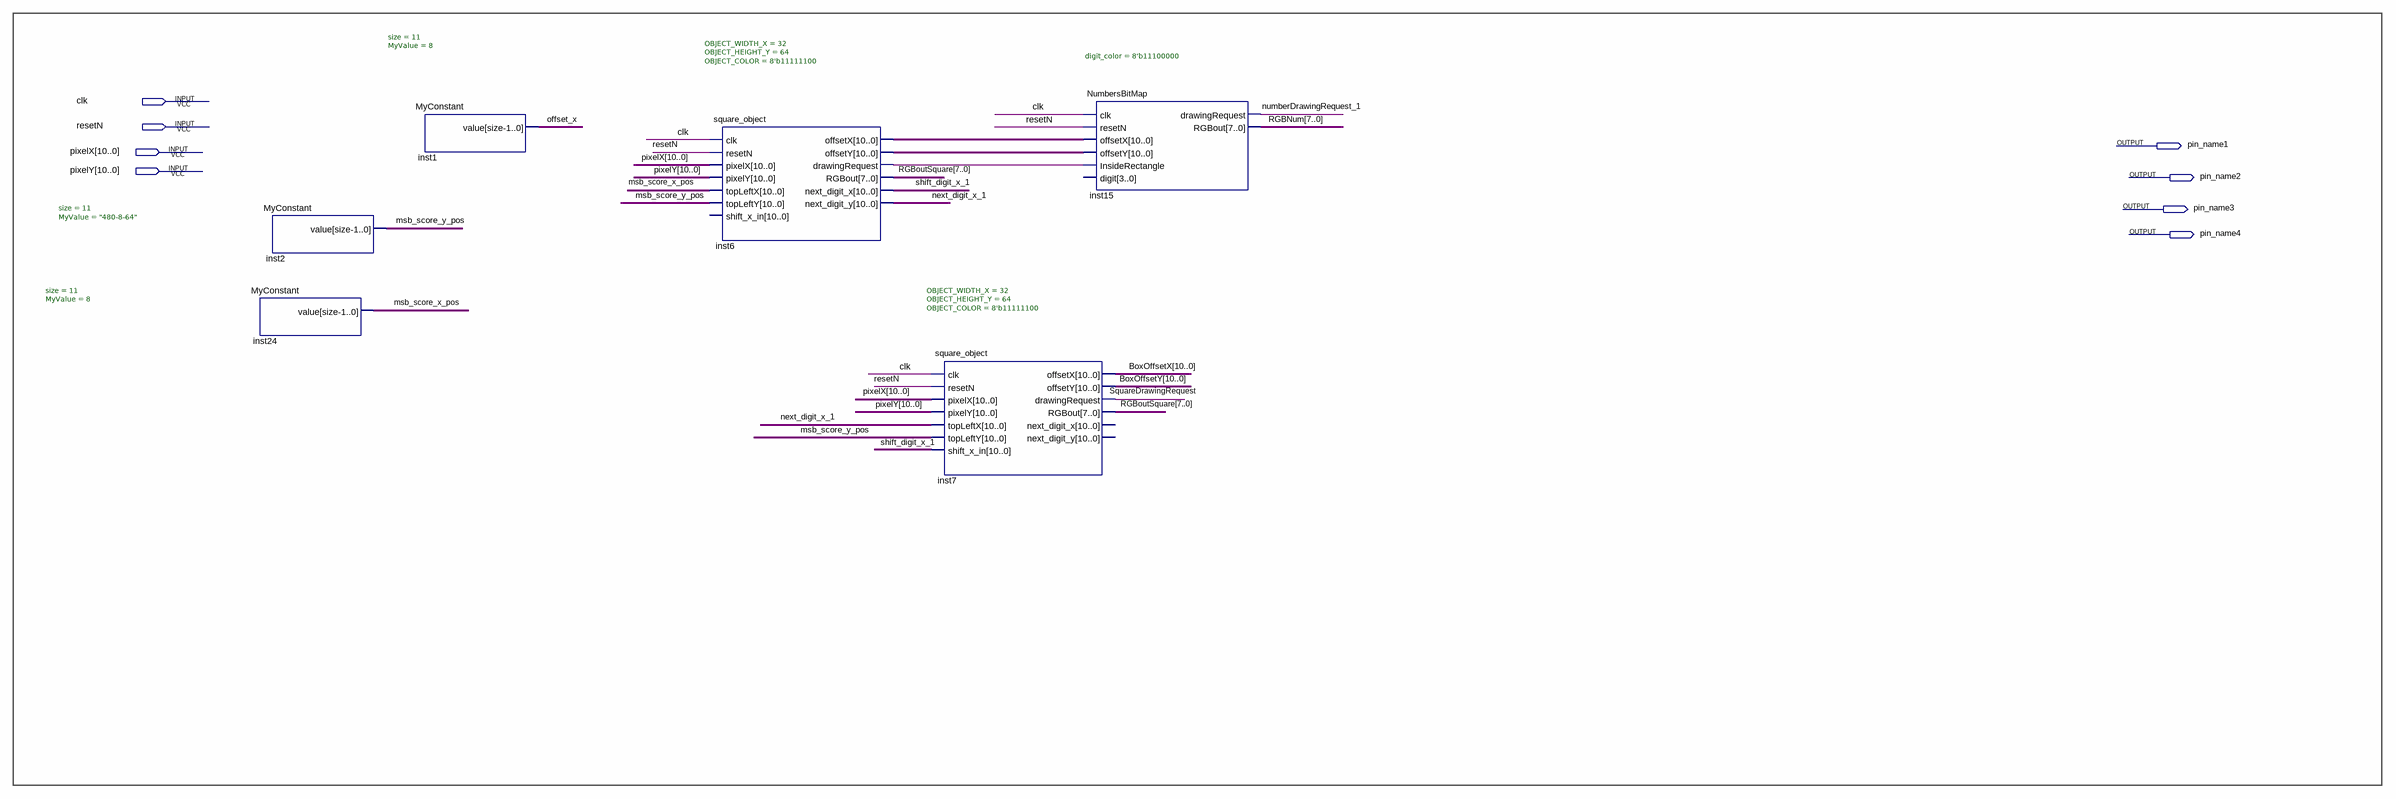
[diagram p0: schematic sheet]
// Quartus schematic 3_digits_display.bdf as structural Verilog: 6 symbols, 8 pins
module \3_digits_display  (
  input  clk,
  input  resetN,
  input  [10:0] pixelX,
  input  [10:0] pixelY,
  output pin_name1,
  output pin_name2,
  output pin_name3,
  output pin_name4
);

  wire inst6_drawingrequest, msb_score_x_pos, msb_score_y_pos, next_digit_x_1, numberDrawingRequest_1,
       offset_x, shift_digit_x_1, SquareDrawingRequest;
  wire [7:0] RGBNum, RGBoutSquare;
  wire [10:0] BoxOffsetX, BoxOffsetY, inst6_offsetx, inst6_offsety;

  MyConstant #(.size(11), .MyValue("480-8-64")) inst2 (.value(msb_score_y_pos));
  MyConstant #(.size(11), .MyValue(8)) inst24 (.value(msb_score_x_pos));
  MyConstant #(.size(11), .MyValue(8)) inst1 (.value(offset_x));
  square_object #(.OBJECT_WIDTH_X(32), .OBJECT_HEIGHT_Y(64), .OBJECT_COLOR(8'b11111100)) inst6 (
    .clk(clk), .resetN(resetN), .pixelX(pixelX), .pixelY(pixelY), .topLeftX({11{msb_score_x_pos}}),
    .topLeftY({11{msb_score_y_pos}}), .offsetX(inst6_offsetx), .offsetY(inst6_offsety),
    .drawingRequest(inst6_drawingrequest), .RGBout(RGBoutSquare), .next_digit_x(shift_digit_x_1),
    .next_digit_y(next_digit_x_1));  // open: shift_x_in
  square_object #(.OBJECT_WIDTH_X(32), .OBJECT_HEIGHT_Y(64), .OBJECT_COLOR(8'b11111100)) inst7 (
    .clk(clk), .resetN(resetN), .pixelX(pixelX), .pixelY(pixelY), .topLeftX({11{next_digit_x_1}}),
    .topLeftY({11{msb_score_y_pos}}), .shift_x_in({11{shift_digit_x_1}}), .offsetX(BoxOffsetX),
    .offsetY(BoxOffsetY), .drawingRequest(SquareDrawingRequest), .RGBout(RGBoutSquare));  // open: next_digit_x, next_digit_y
  NumbersBitMap #(.digit_color(8'b11100000)) inst15 (
    .clk(clk), .resetN(resetN), .offsetX(inst6_offsetx), .offsetY(inst6_offsety),
    .InsideRectangle(inst6_drawingrequest), .drawingRequest(numberDrawingRequest_1), .RGBout(RGBNum));  // open: digit
endmodule
